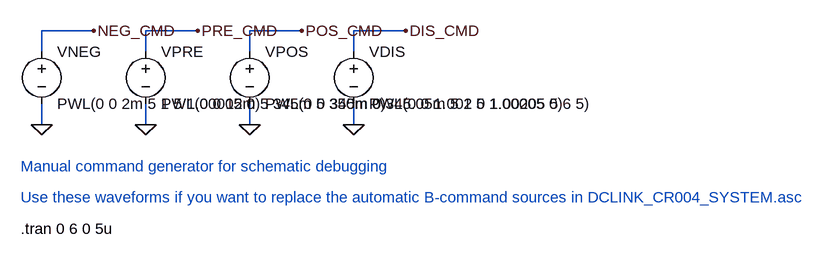
[diagram p0: schematic DCLINK_CR004_MANUAL_DEBUG.asc]
DCLINK_CR004_MANUAL_DEBUG.asc, the LTspice schematic file:
Version 4
SHEET 1 1000 720
WIRE 160 96 80 96
WIRE 320 96 240 96
WIRE 480 96 400 96
WIRE 640 96 560 96
WIRE 80 128 80 96
WIRE 240 128 240 96
WIRE 400 128 400 96
WIRE 560 128 560 96
WIRE 80 208 80 240
WIRE 240 208 240 240
WIRE 400 208 400 240
WIRE 560 208 560 240
FLAG 80 240 0
FLAG 240 240 0
FLAG 400 240 0
FLAG 560 240 0
FLAG 160 96 NEG_CMD
FLAG 320 96 PRE_CMD
FLAG 480 96 POS_CMD
FLAG 640 96 DIS_CMD
SYMBOL voltage 80 112 R0
SYMATTR InstName VNEG
SYMATTR Value PWL(0 0 2m 5 1 5 1.00005 0)
SYMBOL voltage 240 112 R0
SYMATTR InstName VPRE
SYMATTR Value PWL(0 0 12m 5 345m 5 350m 0)
SYMBOL voltage 400 112 R0
SYMATTR InstName VPOS
SYMATTR Value PWL(0 0 345m 0 345.05m 5 1 5 1.00005 0)
SYMBOL voltage 560 112 R0
SYMATTR InstName VDIS
SYMATTR Value PWL(0 0 1.002 0 1.00205 5 6 5)
TEXT 48 304 Left 2 ;Manual command generator for schematic debugging
TEXT 48 352 Left 2 ;Use these waveforms if you want to replace the automatic B-command sources in DCLINK_CR004_SYSTEM.asc
TEXT 48 400 Left 2 !.tran 0 6 0 5u

The netlist it stands for:
* DCLINK_CR004_MANUAL_DEBUG.asc
VNEG NEG_CMD 0 PWL(0 0 2m 5 1 5 1.00005 0)
VPRE PRE_CMD 0 PWL(0 0 12m 5 345m 5 350m 0)
VPOS POS_CMD 0 PWL(0 0 345m 0 345.05m 5 1 5 1.00005 0)
VDIS DIS_CMD 0 PWL(0 0 1.002 0 1.00205 5 6 5)
* Manual command generator for schematic debugging
* Use these waveforms if you want to replace the automatic B-command sources in DCLINK_CR004_SYSTEM.asc
.tran 0 6 0 5u
.backanno
.end